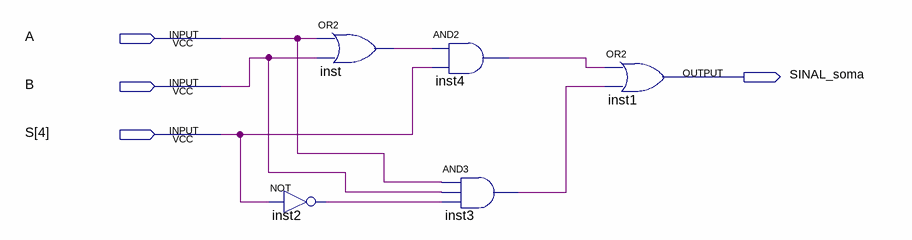
[diagram p0: schematic sheet]
// Quartus schematic SINAL_soma.bdf as structural Verilog: 5 symbols, 4 pins
module SINAL_soma (
  input  A,
  input  B,
  input  [4:4] S,
  output SINAL_soma
);

  wire inst2_out, inst3_out, inst4_out, inst_out;

  not inst2 (inst2_out, S[4]);
  or inst (inst_out, A, B);
  and inst4 (inst4_out, inst_out, S[4]);
  and inst3 (inst3_out, A, B, inst2_out);
  or inst1 (SINAL_soma, inst4_out, inst3_out);
endmodule
